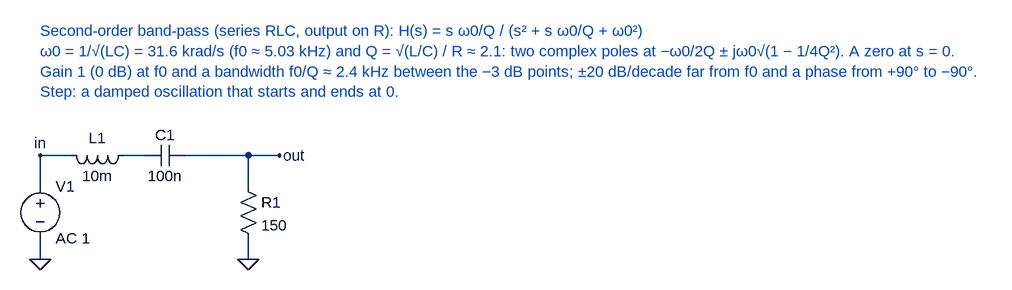
[diagram p0: schematic bp2.asc]
bp2.asc, the LTspice schematic file:
Version 4
SHEET 1 1200 800
WIRE 0 -32 48 -32
WIRE 128 -32 160 -32
WIRE 224 -32 320 -32
WIRE 320 -32 368 -32
WIRE 320 -32 320 16
WIRE 320 96 320 128
WIRE 0 16 0 -32
WIRE 0 96 0 128
FLAG 320 128 0
FLAG 368 -32 out
FLAG 0 128 0
FLAG 0 -32 in
SYMBOL voltage 0 0 R0
SYMATTR InstName V1
SYMATTR Value AC 1
SYMBOL ind 144 -48 R90
WINDOW 0 5 56 VBottom 2
WINDOW 3 32 56 VTop 2
SYMATTR InstName L1
SYMATTR Value 10m
SYMATTR SpiceLine Rser=0
SYMBOL cap 224 -48 R90
WINDOW 0 0 32 VBottom 2
WINDOW 3 32 32 VTop 2
SYMATTR InstName C1
SYMATTR Value 100n
SYMBOL res 304 0 R0
SYMATTR InstName R1
SYMATTR Value 150
TEXT 0 -224 Left 2 ;Second-order band-pass (series RLC, output on R): H(s) = s ω0/Q / (s² + s ω0/Q + ω0²)\nω0 = 1/√(LC) = 31.6 krad/s (f0 ≈ 5.03 kHz) and Q = √(L/C) / R ≈ 2.1: two complex poles at −ω0/2Q ± jω0√(1 − 1/4Q²). A zero at s = 0.\nGain 1 (0 dB) at f0 and a bandwidth f0/Q ≈ 2.4 kHz between the −3 dB points; ±20 dB/decade far from f0 and a phase from +90° to −90°.\nStep: a damped oscillation that starts and ends at 0.

The netlist it stands for:
* bp2.asc
V1 in 0 AC 1
L1 N001 in 10m Rser=0
C1 out N001 100n
R1 out 0 150
* Second-order band-pass (series RLC, output on R): H(s) = s ω0/Q / (s² + s ω0/Q + ω0²)
* ω0 = 1/√(LC) = 31.6 krad/s (f0 ≈ 5.03 kHz) and Q = √(L/C) / R ≈ 2.1: two complex poles at −ω0/2Q ± jω0√(1 − 1/4Q²). A zero at s = 0.
* Gain 1 (0 dB) at f0 and a bandwidth f0/Q ≈ 2.4 kHz between the −3 dB points; ±20 dB/decade far from f0 and a phase from +90° to −90°.
* Step: a damped oscillation that starts and ends at 0.
.backanno
.end